# Altium schematic sheet D_output.SchDoc
size A; SheetNumber: 3; SheetTotal: 9
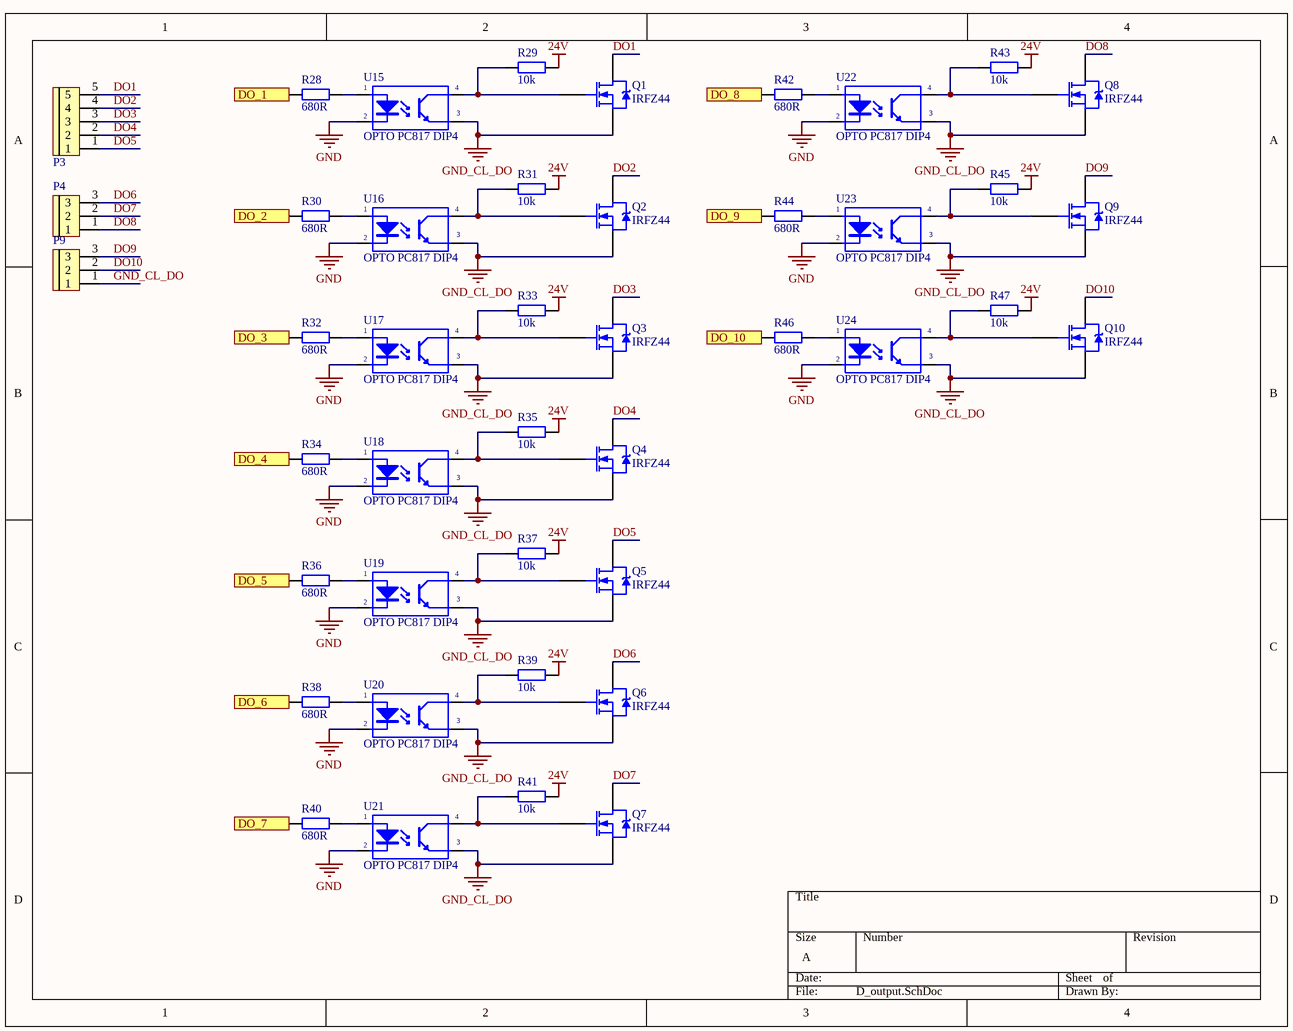
[diagram p0: D_output.SchDoc]

## Parts
P3  CON 5 EDG5.08  [CON 5 5EDG5.08]  (value not drawn)
P4  CON 3 EDG5.08  [CON 3 3EDG5.08]  (value not drawn)
P9  CON 3 EDG5.08  [CON 3 3EDG5.08]  (value not drawn)
Q1  IRFZ44  [TO220]
Q2  IRFZ44  [TO220]
Q3  IRFZ44  [TO220]
Q4  IRFZ44  [TO220]
Q5  IRFZ44  [TO220]
Q6  IRFZ44  [TO220]
Q7  IRFZ44  [TO220]
Q8  IRFZ44  [TO220]
Q9  IRFZ44  [TO220]
Q10  IRFZ44  [TO220]
R28  680R  [tro smd 0805]
R29  10k  [tro smd 0805]
R30  680R  [tro smd 0805]
R31  10k  [tro smd 0805]
R32  680R  [tro smd 0805]
R33  10k  [tro smd 0805]
R34  680R  [tro smd 0805]
R35  10k  [tro smd 0805]
R36  680R  [tro smd 0805]
R37  10k  [tro smd 0805]
R38  680R  [tro smd 0805]
R39  10k  [tro smd 0805]
R40  680R  [tro smd 0805]
R41  10k  [tro smd 0805]
R42  680R  [tro smd 0805]
R43  10k  [tro smd 0805]
R44  680R  [tro smd 0805]
R45  10k  [tro smd 0805]
R46  680R  [tro smd 0805]
R47  10k  [tro smd 0805]
U15  OPTO PC817 DIP4  [DIP4]
U16  OPTO PC817 DIP4  [DIP4]
U17  OPTO PC817 DIP4  [DIP4]
U18  OPTO PC817 DIP4  [DIP4]
U19  OPTO PC817 DIP4  [DIP4]
U20  OPTO PC817 DIP4  [DIP4]
U21  OPTO PC817 DIP4  [DIP4]
U22  OPTO PC817 DIP4  [DIP4]
U23  OPTO PC817 DIP4  [DIP4]
U24  OPTO PC817 DIP4  [DIP4]

## Ports
DO_1 (in), DO_2 (in), DO_3 (in), DO_4 (in), DO_5 (in), DO_6 (in), DO_7 (in), DO_8 (in), DO_9 (in), DO_10 (in)

## Nets
24V: R29.2 R31.2 R33.2 R35.2 R37.2 R39.2 R41.2 R43.2 R45.2 R47.2
GND: U15.2(K) U16.2(K) U17.2(K) U18.2(K) U19.2(K) U20.2(K) U21.2(K) U22.2(K) U23.2(K) U24.2(K)
GND_CL_DO: P9.1 Q1.3(S) Q2.3(S) Q3.3(S) Q4.3(S) Q5.3(S) Q6.3(S) Q7.3(S) Q8.3(S) Q9.3(S) Q10.3(S) U15.3(E) U16.3(E) U17.3(E) U18.3(E) U19.3(E) U20.3(E) U21.3(E) U22.3(E) U23.3(E) U24.3(E)
DO1: P3.5 Q1.2(D)
DO2: P3.4 Q2.2(D)
DO3: P3.3 Q3.2(D)
DO4: P3.2 Q4.2(D)
DO5: P3.1 Q5.2(D)
DO6: P4.3 Q6.2(D)
DO7: P4.2 Q7.2(D)
DO8: P4.1 Q8.2(D)
DO9: P9.3 Q9.2(D)
DO10: P9.2 Q10.2(D)
DO_1: R28.2 ; port DO_1
DO_2: R30.2 ; port DO_2
DO_3: R32.2 ; port DO_3
DO_4: R34.2 ; port DO_4
DO_5: R36.2 ; port DO_5
DO_6: R38.2 ; port DO_6
DO_7: R40.2 ; port DO_7
DO_8: R42.2 ; port DO_8
DO_9: R44.2 ; port DO_9
DO_10: R46.2 ; port DO_10
NetQ1_1: Q1.1(G) R29.1 U15.4(C)
NetQ2_1: Q2.1(G) R31.1 U16.4(C)
NetQ3_1: Q3.1(G) R33.1 U17.4(C)
NetQ4_1: Q4.1(G) R35.1 U18.4(C)
NetQ5_1: Q5.1(G) R37.1 U19.4(C)
NetQ6_1: Q6.1(G) R39.1 U20.4(C)
NetQ7_1: Q7.1(G) R41.1 U21.4(C)
NetQ8_1: Q8.1(G) R43.1 U22.4(C)
NetQ9_1: Q9.1(G) R45.1 U23.4(C)
NetQ10_1: Q10.1(G) R47.1 U24.4(C)
NetR28_1: R28.1 U15.1(A)
NetR30_1: R30.1 U16.1(A)
NetR32_1: R32.1 U17.1(A)
NetR34_1: R34.1 U18.1(A)
NetR36_1: R36.1 U19.1(A)
NetR38_1: R38.1 U20.1(A)
NetR40_1: R40.1 U21.1(A)
NetR42_1: R42.1 U22.1(A)
NetR44_1: R44.1 U23.1(A)
NetR46_1: R46.1 U24.1(A)

## Library data of the parts
P3 = CON 5 EDG5.08: Cắm; Ten_Linh_Kien: CON 5 2EDG5.08-5P 5.08MM ( Xanh Cong); Ma_Hang: MH003589; Kieu_Chan: *; Don_Vi: Con; Ghi_Chu: *; Chung_Loai: Cắm
P4 P9 = CON 3 EDG5.08: Cắm; Ten_Linh_Kien: CON 3 2EDG5.08-3P 5.08MM ( Xanh Cong); Ma_Hang: MH000760; Ghi_Chu: *; Kieu_Chan: *; Don_Vi: Con; Chung_Loai: Cắm
Q1-Q10 = FET IRFZ44 DIP: TO-220
R28-R47 = Tro 0805 1% 10k: Dán; Don_Vi: Con; So_Chan: 2; Ten_Linh_Kien: Trở 0805 1% 10k; Ma_Hang: MH005473; Chung_Loai: Dán; Kieu_Chan: *
U15-U24 = OPTO PC817 DIP4: Single Opto; Value: PC817